# Altium project Flex-LED-Board_v2.2.PrjPcb
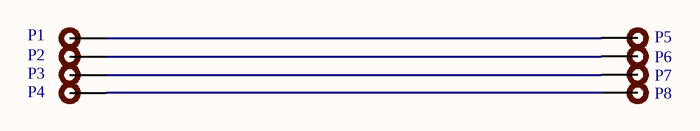
[diagram p0: Flex-LED.SchDoc]
1 sheet, 8 parts. Net scope: global (net labels, ports and power ports of the same name join across sheets).
Board file: PCB_Flex_LED_v2.2.PcbDoc

## Sheet Flex-LED.SchDoc
size A; SheetNumber: 1; SheetTotal: 1

### Parts
P1  0.5mm Test Pad  [0.5mm Test Pad]  (value not drawn)  (no BOM)
P2  0.5mm Test Pad  [0.5mm Test Pad]  (value not drawn)  (no BOM)
P3  0.5mm Test Pad  [0.5mm Test Pad]  (value not drawn)  (no BOM)
P4  0.5mm Test Pad  [0.5mm Test Pad]  (value not drawn)  (no BOM)
P5  0.5mm Test Pad  [0.5mm Test Pad]  (value not drawn)  (no BOM)
P6  0.5mm Test Pad  [0.5mm Test Pad]  (value not drawn)  (no BOM)
P7  0.5mm Test Pad  [0.5mm Test Pad]  (value not drawn)  (no BOM)
P8  0.5mm Test Pad  [0.5mm Test Pad]  (value not drawn)  (no BOM)

### Nets
NetP1_1: P1.1 P5.1
NetP2_1: P2.1 P6.1
NetP3_1: P3.1 P7.1
NetP4_1: P4.1 P8.1

### Library data of the parts
P1-P8 = 0.5mm Test Pad: Test pad